# Altium schematic sheet Crystal_holder.SchDoc
size A3; SheetNumber: 1; SheetTotal: 1
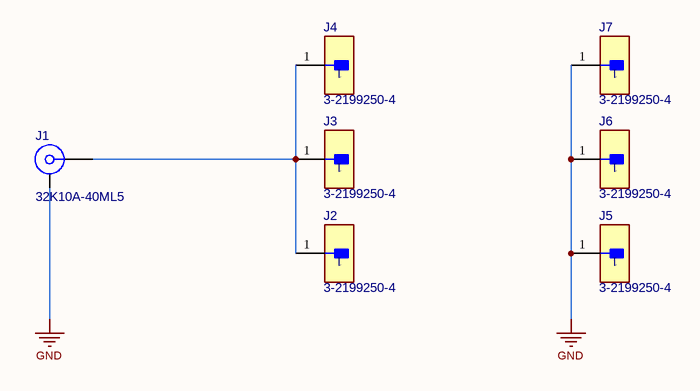
[diagram p0: Crystal_holder.SchDoc]

## Parts
?  (no value)  (graphical)
J1  32K10A-40ML5  [ROS-32K10A-40ML5_V]
J2  3-2199250-4  [FP-3-2199250-4-MFG]
J3  3-2199250-4  [FP-3-2199250-4-MFG]
J4  3-2199250-4  [FP-3-2199250-4-MFG]
J5  3-2199250-4  [FP-3-2199250-4-MFG]
J6  3-2199250-4  [FP-3-2199250-4-MFG]
J7  3-2199250-4  [FP-3-2199250-4-MFG]

## Nets
GND: J1.MP J5.1 J6.1 J7.1
NetJ1_1: J1.1 J2.1 J3.1 J4.1

## Notes on the sheet
- Date:
- ELD/LION, Leiden University
- Engineer:
- Sheet:
- of
- Revision:
- File:

## Library data of the parts
? = TitleBlock-ELD
J1 = CMP-0751-00003-1: SMA Straight Jack, Up to 12.4 GHz, -55 to 155 degC; Manufacturer: Rosenberger; Design Note: Footprint in library is a generic example - only application specific footprint delivers High Performance; ComponentLink4Description: Series Overview / Design Note; ComponentLink3URL: http://rosenberger.de/ok/images/documents/db/32K10A-40ML5.pdf; ComponentLink3Description: Package Specification; ComponentLink1URL: http://www.rosenberger.de; PartNumber: 32K10A-40ML5; ComponentLink1Description: Manufacturer URL; ComponentLink2Description: Datasheet; PackageDescription: SMA Straight Jack, Press-Fit, 6.35 x 6.35 x 9.5 mm; ComponentLink5URL: http://www.rosenberger.com/en/contact/sales/; ComponentLink5Description: Webshop / RFQ; ComponentLink2URL: http://rosenberger.de/ok/images/documents/db/32K10A-40ML5.pdf; PackageVersion: e00; DatasheetVersion: e00; Mounting Technology: Surface Mount; PackageReference: 32K10A-40ML5; ComponentLink4URL: http://rosenberger.de/ok/images/documents/spez/32.pdf
J2-J7 = CMP-03364-000003-1: 3.6H SPRNG FINGER TYPE C SMT; Preloaded: No; Current Rating: 2A; Plating Thickness: 0.5um; Lead Free: Lead Free; ELV: Compliant; Contact Plating: Gold; RoHS Compliant: Yes; Width: 1.5mm; Packaging: Tape and Reel